# Altium schematic sheet LoRa.SchDoc
size A; SheetNumber: 2; SheetTotal: 3
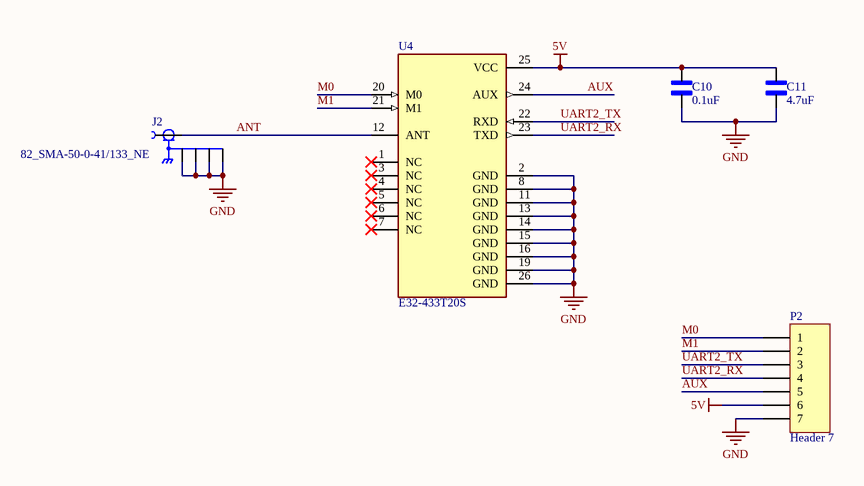
[diagram p0: LoRa.SchDoc]

## Parts
C10  0.1uF  [CAPC1005X61N]
C11  4.7uF  [CAPC1005X61N]
J2  82_SMA-50-0-41/133_NE  [HUBER+SUHNER_82_SMA-50-0-41/133_NE]
P2  Header 7  [HDR1X7]
U4  E32-433T20S  [MODULE_E32-433T20S]

## Nets
5V: C10.2 C11.2 P2.6 U4.25(VCC)
GND: C10.1 C11.1 J2.G1 J2.G2 J2.G3 J2.G4 P2.7 U4.2(GND) U4.8(GND) U4.11(GND) U4.13(GND) U4.14(GND) U4.15(GND) U4.16(GND) U4.19(GND) U4.26(GND)
ANT: J2.1 U4.12(ANT)
AUX: P2.5 U4.24(AUX)
M0: P2.1 U4.20(M0)
M1: P2.2 U4.21(M1)
UART2_RX: P2.4 U4.23(TXD)
UART2_TX: P2.3 U4.22(RXD)

Not connected (* = marked no-connect by the designer): U4 1(NC)* 3(NC)* 4(NC)* 5(NC)* 6(NC)* 7(NC)*

## Library data of the parts
C10 C11 = cap_0402_VJ0402D100MXCAP: cap 0402; MF: Vishay Vitramon; SnapEDA_Link: https://www.snapeda.com/parts/VJ0402D100MXCAP/Vishay/view-part/?ref=snap; Package: 1005 Vishay Vitramon; Value: *; MP: VJ0402D100MXCAP; Check_prices: https://www.snapeda.com/parts/VJ0402D100MXCAP/Vishay/view-part/?ref=eda
J2 = 82_SMA-50-0-41/133_NE: RF Connectors / Coaxial Connectors, Straight Pcb Jack | HUBER+SUHNER 82_SMA-50-0-41/133_NE; SnapEDA_Link: https://www.snapeda.com/parts/82_SMA-50-0-41/133_NE/Huber%252BSuhner/view-part/?ref=snap; Package: None; Value: *; MF: HUBER+SUHNER; MP: 82_SMA-50-0-41/133_NE; Check_prices: https://www.snapeda.com/parts/82_SMA-50-0-41/133_NE/Huber%252BSuhner/view-part/?ref=eda
P2 = Header 7: Header, 7-Pin; LatestRevisionDate: 17-Jul-2002; LatestRevisionNote: Re-released for DXP Platform.; Publisher: Altium Limited
U4 = E32-433T20S: Wireless serial port module (UART); MF: EBYTE; Check_prices: https://www.snapeda.com/parts/E32-433T20S/EBYTE/view-part/?ref=eda; Package: Package; MP: E32-433T20S; Value: *; SnapEDA_Link: https://www.snapeda.com/parts/E32-433T20S/EBYTE/view-part/?ref=snap; Price: None; Availability: Not in stock